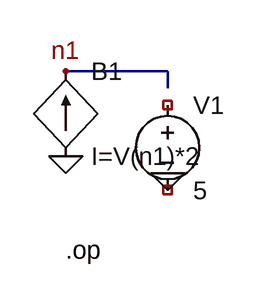
[diagram p0: schematic Simbolo - bi2.asc]
Simbolo - bi2.asc, the LTspice schematic file:
Version 4
SHEET 1 880 680
WIRE 64 112 160 112
WIRE 160 112 160 128
FLAG 64 192 0
FLAG 160 208 0
FLAG 64 112 n1
SYMBOL bi2 64 112 R0
SYMATTR InstName B1
SYMATTR Value I=V(n1)*2
SYMBOL voltage 160 128 R0
SYMATTR InstName V1
SYMATTR Value 5
TEXT 64 280 Left 2 !.op

The netlist it stands for:
* Simbolo - bi2.asc
B1 0 n1 I=V(n1)*2
V1 NC_01 NC_02 5
.op
.backanno
.end